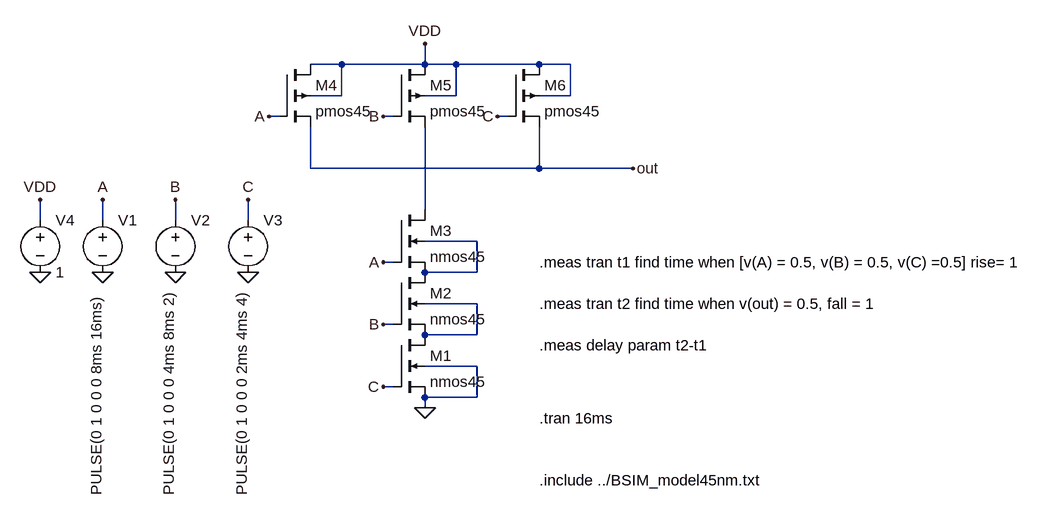
[diagram p0: schematic ( Uge 6 ) - Exercise 2.asc]
( Uge 6 ) - Exercise 2.asc, the LTspice schematic file:
Version 4
SHEET 1 1400 680
WIRE 304 -64 256 -64
WIRE 432 -64 432 -96
WIRE 432 -64 304 -64
WIRE 480 -64 432 -64
WIRE 608 -64 480 -64
WIRE 656 -64 608 -64
WIRE 304 -16 304 -64
WIRE 304 -16 256 -16
WIRE 480 -16 480 -64
WIRE 480 -16 432 -16
WIRE 656 -16 656 -64
WIRE 656 -16 608 -16
WIRE 208 16 192 16
WIRE 384 16 368 16
WIRE 560 16 544 16
WIRE 256 96 256 32
WIRE 608 96 608 32
WIRE 608 96 256 96
WIRE 752 96 608 96
WIRE 432 160 432 32
WIRE -160 176 -160 144
WIRE -64 176 -64 144
WIRE 48 176 48 144
WIRE 160 176 160 144
WIRE 512 208 432 208
WIRE 384 240 368 240
WIRE 512 256 512 208
WIRE 512 256 432 256
WIRE 512 304 432 304
WIRE 384 336 368 336
WIRE 512 352 512 304
WIRE 512 352 432 352
WIRE 512 400 432 400
WIRE 384 432 368 432
WIRE 512 448 512 400
WIRE 512 448 432 448
WIRE 432 464 432 448
FLAG 432 464 0
FLAG -160 256 0
FLAG -64 256 0
FLAG -160 144 VDD
FLAG -64 144 A
FLAG 48 256 0
FLAG 48 144 B
FLAG 160 256 0
FLAG 160 144 C
FLAG 192 16 A
FLAG 368 16 B
FLAG 544 16 C
FLAG 432 -96 VDD
FLAG 368 240 A
FLAG 368 336 B
FLAG 368 432 C
FLAG 752 96 out
SYMBOL nmos4 384 352 R0
SYMATTR InstName M1
SYMATTR Value nmos45
SYMATTR Value2 l=60nm w=200nm
SYMBOL nmos4 384 256 R0
SYMATTR InstName M2
SYMATTR Value nmos45
SYMATTR Value2 l=60nm w=200nm
SYMBOL nmos4 384 160 R0
SYMATTR InstName M3
SYMATTR Value nmos45
SYMATTR Value2 l=60nm w=200nm
SYMBOL pmos4 208 -64 R0
SYMATTR InstName M4
SYMATTR Value pmos45
SYMATTR Value2 l=60nm w=400nm
SYMBOL pmos4 384 -64 R0
SYMATTR InstName M5
SYMATTR Value pmos45
SYMATTR Value2 l=60nm w=400nm
SYMBOL pmos4 560 -64 R0
SYMATTR InstName M6
SYMATTR Value pmos45
SYMATTR Value2 l=60nm w=400nm
SYMBOL Voltage -64 160 R0
WINDOW 3 -10 439 VLeft 2
SYMATTR Value PULSE(0 1 0 0 0 8ms 16ms)
SYMATTR InstName V1
SYMBOL Voltage -160 160 R0
SYMATTR InstName V4
SYMATTR Value 1
SYMBOL Voltage 48 160 R0
WINDOW 3 -10 439 VLeft 2
SYMATTR Value PULSE(0 1 0 0 0 4ms 8ms 2)
SYMATTR InstName V2
SYMBOL Voltage 160 160 R0
WINDOW 3 -10 439 VLeft 2
SYMATTR Value PULSE(0 1 0 0 0 2ms 4ms 4)
SYMATTR InstName V3
TEXT 608 240 Left 2 !.meas tran t1 find time when [v(A) = 0.5, v(B) = 0.5, v(C) =0.5] rise= 1
TEXT 608 304 Left 2 !.meas tran t2 find time when v(out) = 0.5, fall = 1
TEXT 608 368 Left 2 !.meas delay param t2-t1
TEXT 608 480 Left 2 !.tran 16ms
TEXT 608 576 Left 2 !.include ../BSIM_model45nm.txt

The netlist it stands for:
* ( Uge 6 ) - Exercise 2.asc
M1 N003 C 0 0 nmos45 l=60nm w=200nm
M2 N002 B N003 N003 nmos45 l=60nm w=200nm
M3 N001 A N002 N002 nmos45 l=60nm w=200nm
M4 VDD A out VDD pmos45 l=60nm w=400nm
M5 VDD B N001 VDD pmos45 l=60nm w=400nm
M6 VDD C out VDD pmos45 l=60nm w=400nm
V1 A 0 PULSE(0 1 0 0 0 8ms 16ms)
V4 VDD 0 1
V2 B 0 PULSE(0 1 0 0 0 4ms 8ms 2)
V3 C 0 PULSE(0 1 0 0 0 2ms 4ms 4)
.model NMOS NMOS
.model PMOS PMOS
.lib standard.mos
.meas tran t1 find time when [v(A) = 0.5, v(B) = 0.5, v(C) =0.5] rise= 1
.meas tran t2 find time when v(out) = 0.5, fall = 1
.meas delay param t2-t1
.tran 16ms
.include ../BSIM_model45nm.txt
.backanno
.end